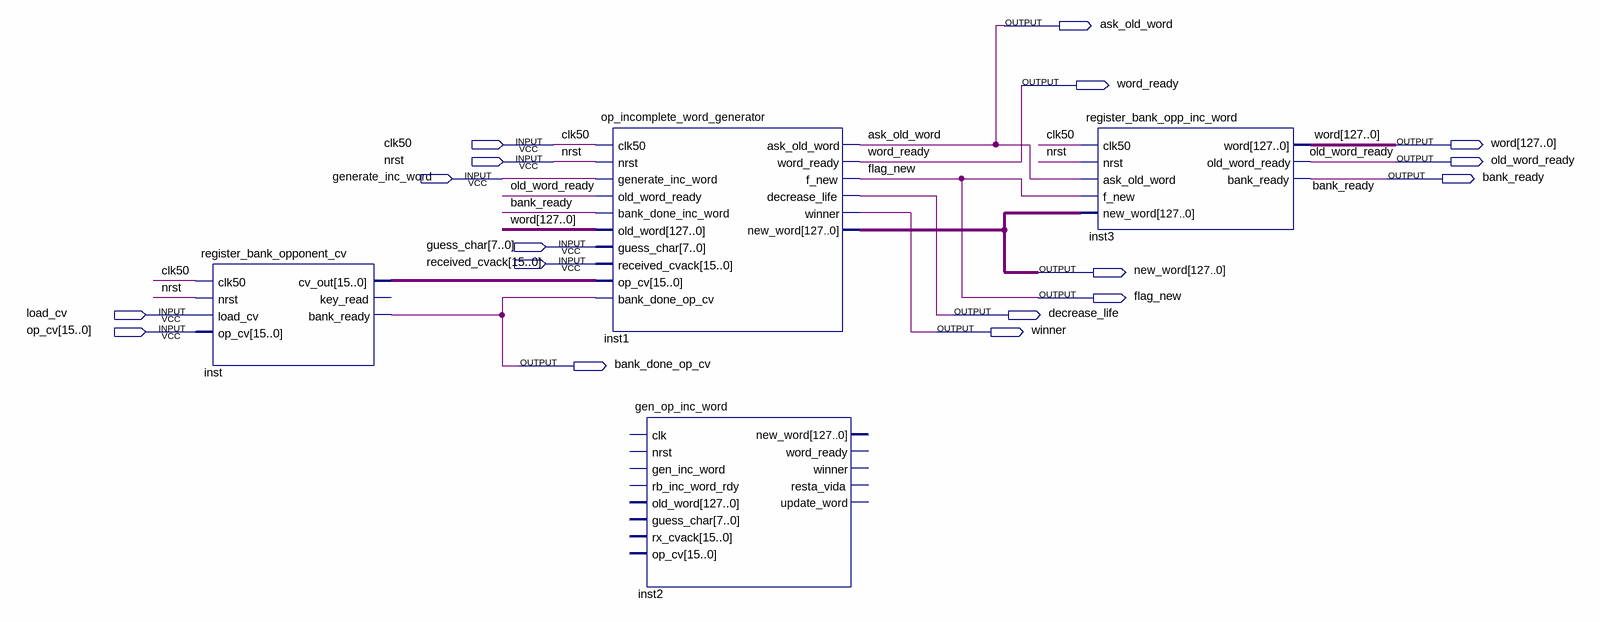
[diagram p0: schematic sheet]
// Quartus schematic opponent_incomplete_word_test.bdf as structural Verilog: 4 symbols, 17 pins
module opponent_incomplete_word_test (
  input  clk50,
  input  nrst,
  input  generate_inc_word,
  input  [7:0] guess_char,
  input  [15:0] received_cvack,
  input  load_cv,
  input  [15:0] op_cv,
  output ask_old_word,
  output word_ready,
  output [127:0] word,
  output old_word_ready,
  output bank_ready,
  output [127:0] new_word,
  output flag_new,
  output decrease_life,
  output winner,
  output bank_done_op_cv
);

  wire [15:0] inst_cv_out;

  register_bank_opponent_cv inst (
    .clk50(clk50), .nrst(nrst), .load_cv(load_cv), .op_cv(op_cv), .cv_out(inst_cv_out),
    .bank_ready(bank_done_op_cv));  // open: key_read
  op_incomplete_word_generator inst1 (
    .clk50(clk50), .nrst(nrst), .generate_inc_word(generate_inc_word), .old_word_ready(old_word_ready),
    .bank_done_inc_word(bank_ready), .old_word(word), .guess_char(guess_char),
    .received_cvack(received_cvack), .op_cv(inst_cv_out), .bank_done_op_cv(bank_done_op_cv),
    .ask_old_word(ask_old_word), .word_ready(word_ready), .f_new(flag_new), .decrease_life(decrease_life),
    .winner(winner), .new_word(new_word));
  gen_op_inc_word inst2 ();  // open: clk, nrst, gen_inc_word, rb_inc_word_rdy, old_word, guess_char, rx_cvack, op_cv, new_word, word_ready, winner, resta_vida, update_word
  register_bank_opp_inc_word inst3 (
    .clk50(clk50), .nrst(nrst), .ask_old_word(ask_old_word), .f_new(flag_new), .new_word(new_word),
    .word(word), .old_word_ready(old_word_ready), .bank_ready(bank_ready));
endmodule
